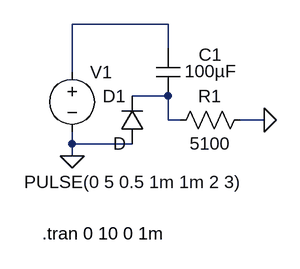
[diagram p0: schematic ClampSoftStart.asc]
ClampSoftStart.asc, the LTspice schematic file:
Version 4
SHEET 1 880 680
WIRE 240 160 112 160
WIRE 240 192 240 160
WIRE 112 224 112 160
WIRE 240 256 192 256
WIRE 240 288 240 256
WIRE 256 288 240 288
WIRE 368 288 336 288
WIRE 112 320 112 304
WIRE 192 320 112 320
WIRE 112 336 112 320
FLAG 112 336 0
FLAG 368 288 0
SYMBOL Voltage 112 208 R0
WINDOW 3 -64 163 Left 2
SYMATTR InstName V1
SYMATTR Value PULSE(0 5 0.5 1m 1m 2 3)
SYMBOL Cap 224 192 R0
WINDOW 0 57 9 Left 2
WINDOW 3 38 31 Left 2
SYMATTR InstName C1
SYMATTR Value 100µF
SYMBOL Res 352 272 R90
WINDOW 0 0 56 VBottom 2
WINDOW 3 32 56 VTop 2
SYMATTR InstName R1
SYMATTR Value 5100
SYMBOL Diode 208 320 R180
WINDOW 0 24 64 Left 2
WINDOW 3 24 0 Left 2
SYMATTR InstName D1
TEXT 72 440 Left 2 !.tran 0 10 0 1m

The netlist it stands for:
* ClampSoftStart.asc
V1 N001 0 PULSE(0 5 0.5 1m 1m 2 3)
C1 N001 N002 100µF
R1 0 N002 5100
D1 0 N002 D
.model D D
.lib standard.dio
.tran 0 10 0 1m
.backanno
.end